# Altium schematic sheet Sheet2.SchDoc
size A4; SheetNumber: 1; SheetTotal: 1
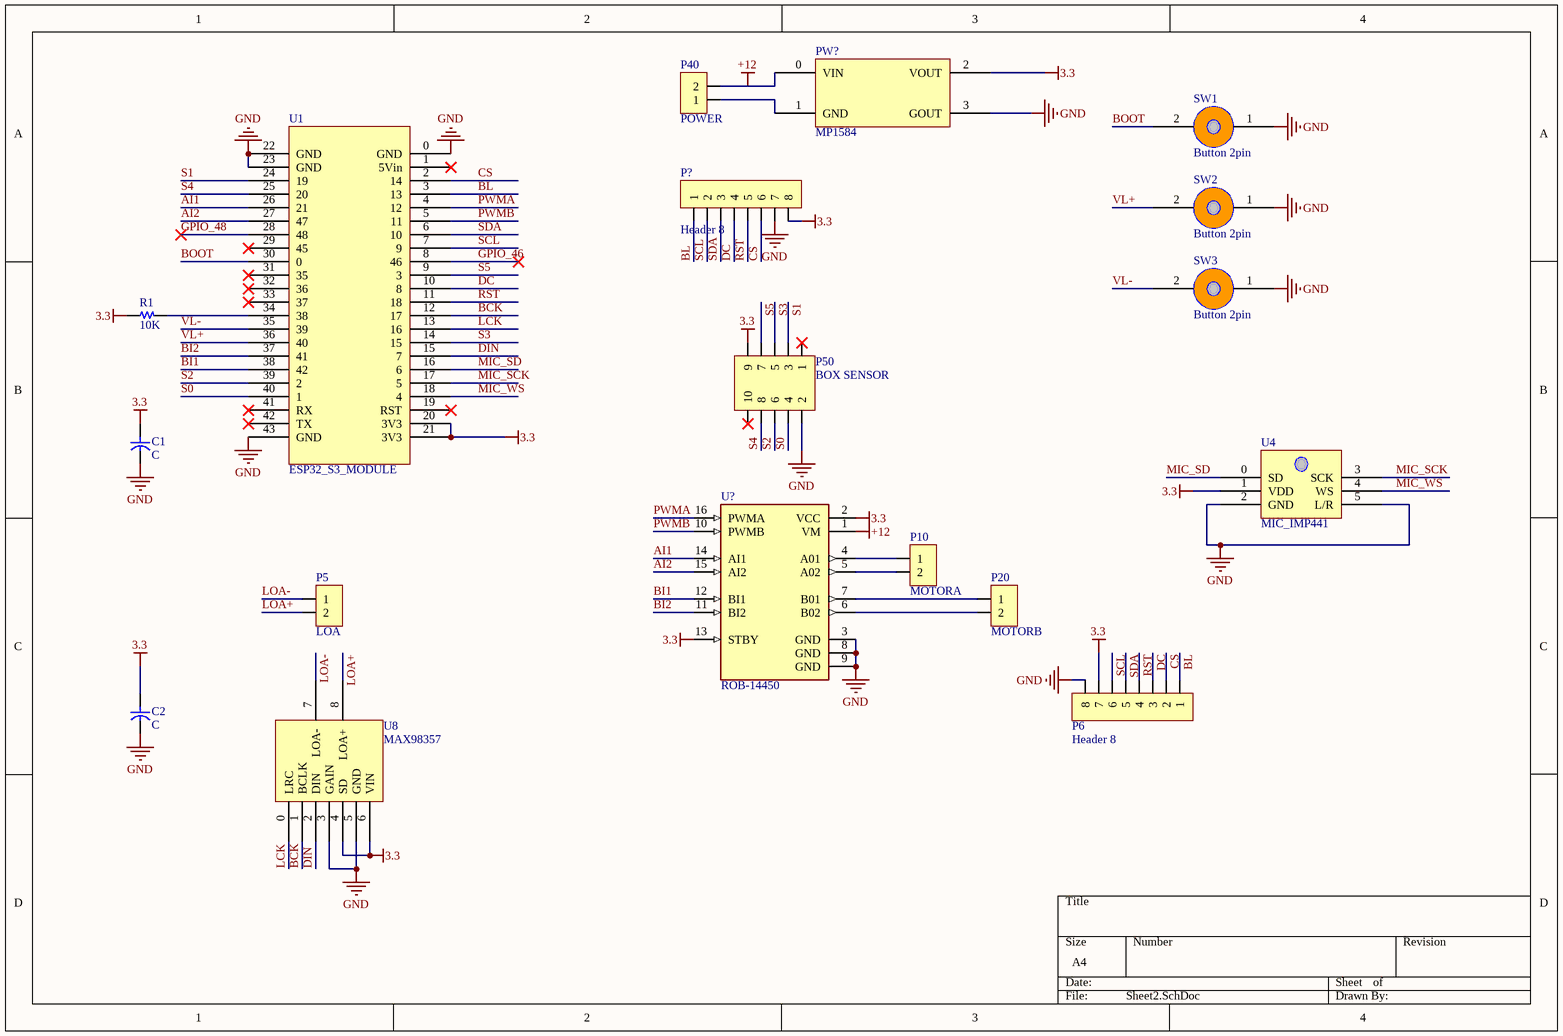
[diagram p0: Sheet2.SchDoc]

## Parts
C1  C  [CYL/D.200/LS.75]
C2  C  [CYL/D.200/LS.75]
P5  LOA  [HDR/Header/2/BOX]
P6  Header 8  [HDR/Header/8]
P10  MOTORA  [HDR/Header/2/BOX]
P20  MOTORB  [HDR/Header/2/BOX]
P40  POWER  [HDR/Header/2/BOX]
P50  BOX SENSOR  [HDR/Header/10/DL/BOX]
P?  Header 8  [HDR/Header/8]
PW?  MP1584  [MP1548]
R1  10K  [R 1/4W/300]
SW1  Button 2pin  [Button2Psilicon]
SW2  Button 2pin  [Button2Psilicon]
SW3  Button 2pin  [Button2Psilicon]
U1  ESP32_S3_MODULE  [ESP32_S3_MODULE]
U4  MIC_IMP441  [IMP441]
U8  MAX98357  [MAX98357]
U?  ROB-14450  [MODULE_ROB-14450]

## Nets
3.3: C1.1 C2.1 P6.7 P50.9 P?.8 PW?.2(VOUT) R1.1 U1.20(3V3) U1.21(3V3) U4.1(VDD) U8.4(SD) U8.6(VIN) U?.2(VCC) U?.13(STBY)
+12: P40.2 PW?.0(VIN) U?.1(VM)
GND: C1.2 C2.2 P6.8 P50.2 P?.7 PW?.3(GOUT) SW1.1 SW2.1 SW3.1 U1.0(GND) U1.22(GND) U1.23(GND) U1.43(GND) U4.2(GND) U4.5(L/R) U8.3(GAIN) U8.5(GND) U?.3(GND) U?.8(GND) U?.9(GND)
AI1: U1.26(21) U?.14(AI1)
AI2: U1.27(47) U?.15(AI2)
BCK: U1.12(17) U8.1(BCLK)
BI1: U1.38(42) U?.12(BI1)
BI2: U1.37(41) U?.11(BI2)
BL: P6.1 P?.1 U1.3(13)
BOOT: SW1.2 U1.30(0)
CS: P6.2 P?.6 U1.2(14)
DC: P6.3 P?.4 U1.10(8)
DIN: U1.15(7) U8.2(DIN)
GPIO_46: U1.8(46)
GPIO_48: U1.28(48)
LCK: U1.13(16) U8.0(LRC)
LOA+: P5.2 U8.8(LOA+)
LOA-: P5.1 U8.7(LOA-)
MIC_SCK: U1.17(5) U4.3(SCK)
MIC_SD: U1.16(6) U4.0(SD)
MIC_WS: U1.18(4) U4.4(WS)
PWMA: U1.4(12) U?.16(PWMA)
PWMB: U1.5(11) U?.10(PWMB)
RST: P6.4 P?.5 U1.11(18)
S0: P50.4 U1.40(1)
S1: P50.3 U1.24(19)
S2: P50.6 U1.39(2)
S3: P50.5 U1.14(15)
S4: P50.8 U1.25(20)
S5: P50.7 U1.9(3)
SCL: P6.6 P?.2 U1.7(9)
SDA: P6.5 P?.3 U1.6(10)
VL+: SW2.2 U1.36(40)
VL-: SW3.2 U1.35(39)
NetP10_1: P10.1 U?.4(A01)
NetP10_2: P10.2 U?.5(A02)
NetP20_1: P20.1 U?.7(B01)
NetP20_2: P20.2 U?.6(B02)
NetP40_1: P40.1 PW?.1(GND)
NetR1_2: R1.2 U1.34(38)

Not connected (* = marked no-connect by the designer): P50 1* 10*; U1 1(5Vin)* 19(RST)* 29(45)* 31(35)* 32(36)* 33(37)* 41(RX)* 42(TX)*

## Library data of the parts
C1 C2 = Capacitor: Capacitor pol
P5 P10 P20 P40 = Header 2: Header, 2-Pin
P6 P? = Header 8: Header, 8-Pin
P50 = Header 5X2: Header, 5-Pin, Dual row
R1 = Resistor
SW1-SW3 = Silicone 2P button SMD
U? = ROB-14450: TB6612FNG Motor Controller/Driver Power Management Evaluation Board; MF: SparkFun Electronics; Check_prices: https://www.snapeda.com/parts/ROB-14450/SparkFun%20Electronics/view-part/2656367/?ref=eda; Package: None; MP: ROB-14450; Value: *; Availability: In Stock; SnapEDA_Link: https://www.snapeda.com/parts/ROB-14450/SparkFun%20Electronics/view-part/2656367/?ref=snap; Price: None